# Altium schematic sheet P1.schdoc
size 889 x 421 mm; Symbol: Sheet-Symbol_A4; Company: 嘉立创EDA; Version: V1.0; Page Size: A4; @Project Name: New Project_2026-10-12_11-10-43; @Page Count: 1; @Update Date: 2026-10-15; @Create Date: 2026-10-12; @Schematic Name: Schematic1; @Page No: 1; @Page Name: P1; Device: Sheet-Symbol_A4
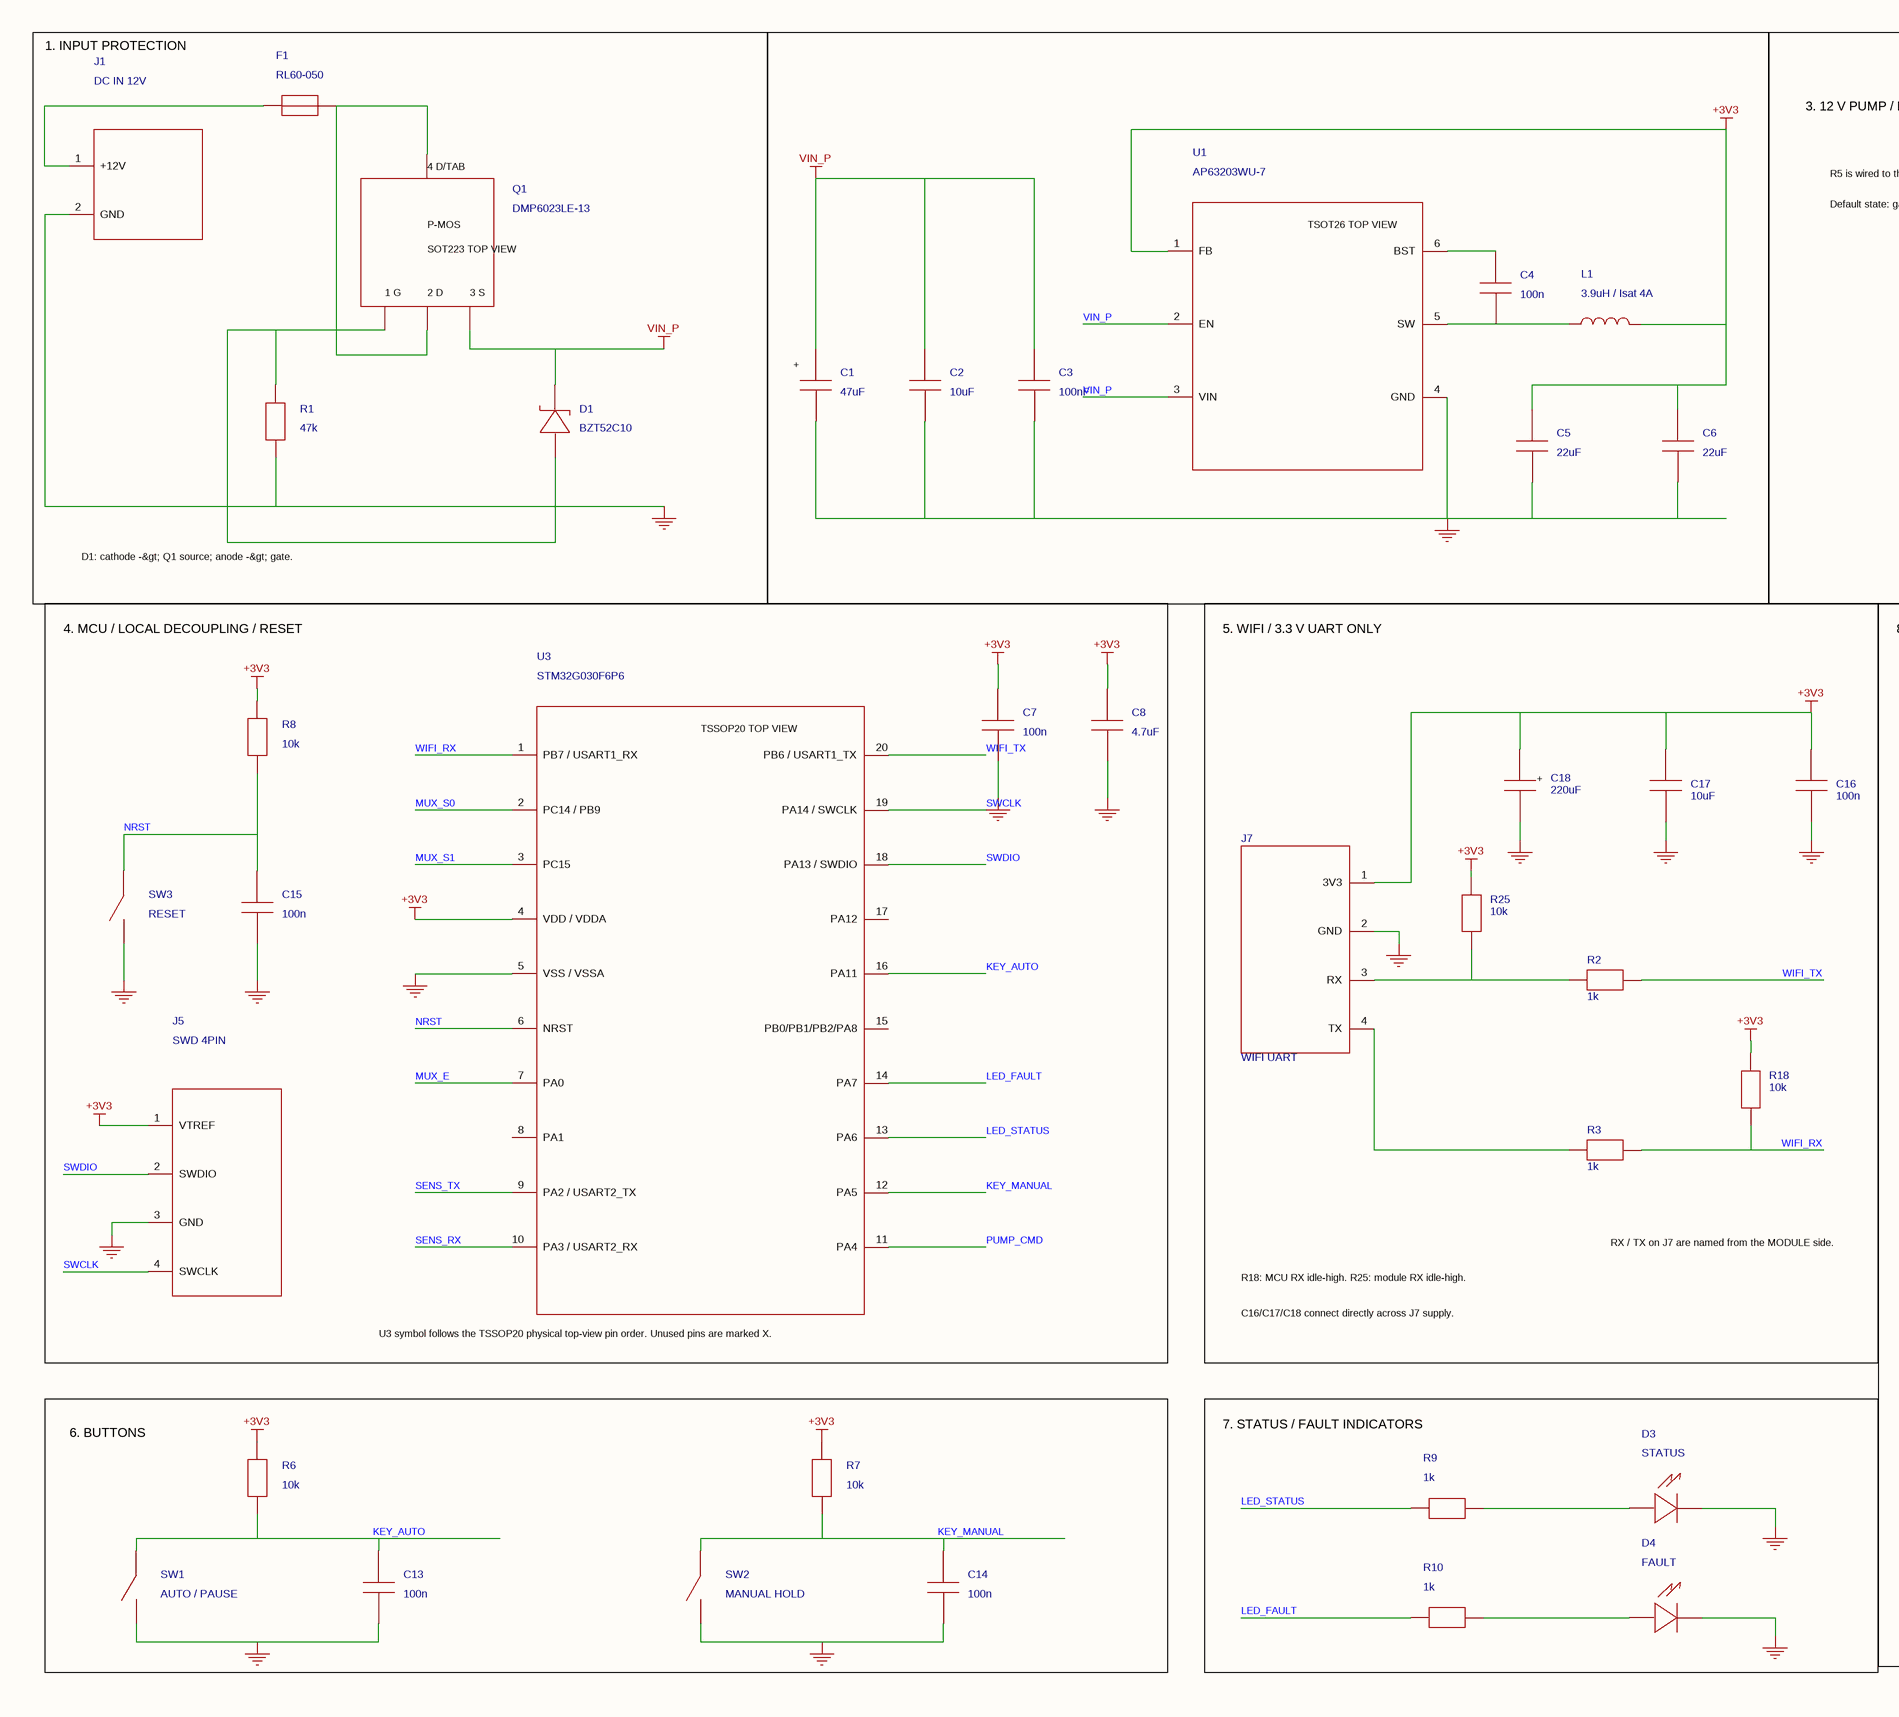
[diagram p0: P1.schdoc, left]
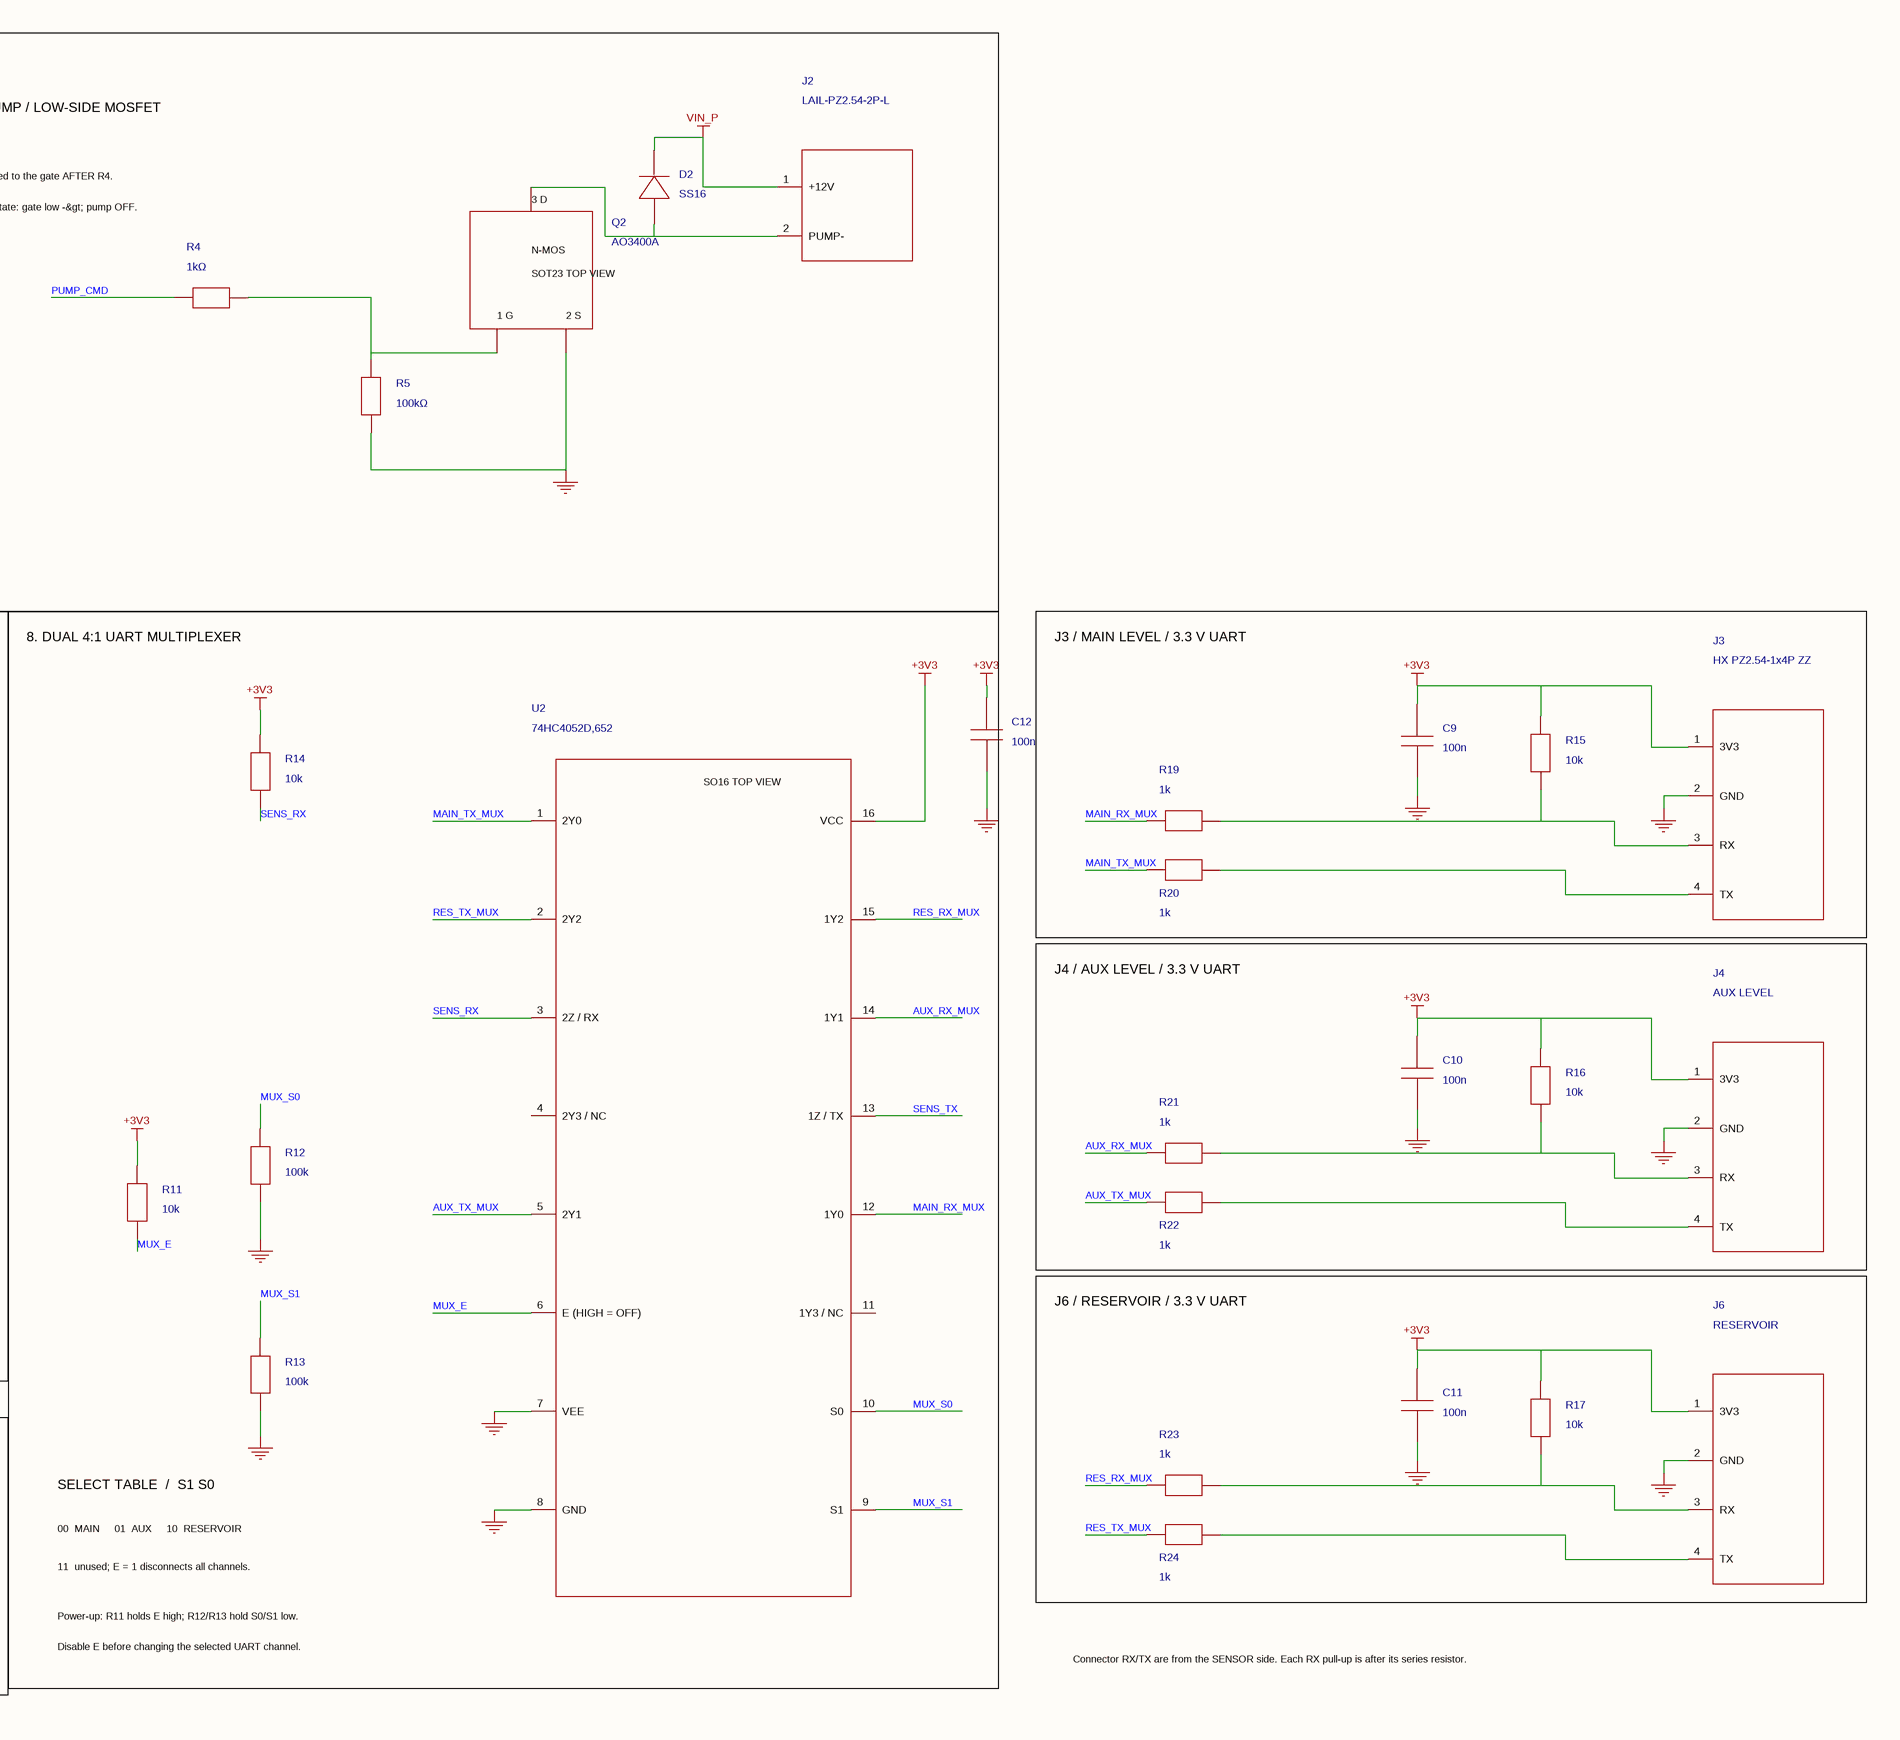
[diagram p1: P1.schdoc, right]

## Parts
C1  47uF  [CAP-TH_BD6.3-P2.50-D0.6-FD]
C2  10uF  [C0805]
C3  100nF  [C0805]
C4  100n
C5  22uF  [C0603]
C6  22uF  [C0603]
C7  100n
C8  4.7uF  [C0603]
C9  100n
C10  100n
C11  100n
C12  100n
C13  100n
C14  100n
C15  100n
C16  100n
C17  10uF  [C0603]
C18  220uF  [C1206]
D1  BZT52C10  [SOD-123_L2.7-W1.6-LS3.7-RD]
D2  SS16  [SMA_L4.3-W2.6-LS5.0-RD]
D3  STATUS
D4  FAULT
F1  RL60-050  [FUSE-TH_L7.8-W3.0-P5.10-D0.5-S2.00]
J1  DC IN 12V
J2  LAIL-PZ2.54-2P-L  [CONN-TH_LAIL-PZ2.54-2P-L]
J3  HX PZ2.54-1x4P ZZ  [HDR-TH_4P-P2.54-V-M]
J4  AUX LEVEL
J5  SWD 4PIN
J6  RESERVOIR
J7  WIFI UART
L1  3.9uH / Isat 4A
Q1  DMP6023LE-13
Q2  AO3400A
R1  47k
R2  1k
R3  1k
R4  1kΩ  [R0603]
R5  100kΩ  [R0603]
R6  10k
R7  10k
R8  10k
R9  1k
R10  1k
R11  10k
R12  100k
R13  100k
R14  10k
R15  10k
R16  10k
R17  10k
R18  10k
R19  1k
R20  1k
R21  1k
R22  1k
R23  1k
R24  1k
R25  10k
SW1  AUTO / PAUSE
SW2  MANUAL HOLD
SW3  RESET
U1  AP63203WU-7
U2  74HC4052D,652
U3  STM32G030F6P6

## Blocks framed on the sheet
1. INPUT PROTECTION: D1 F1 J1 Q1 R1
3. 12 V PUMP / LOW-SIDE MOSFET: D2 J2 Q2 R4 R5
4. MCU / LOCAL DECOUPLING / RESET: C7 C8 C15 J5 R8 SW3 U3
5. WIFI / 3.3 V UART ONLY: C16-C18 J7 R2 R3 R18 R25
J3 / MAIN LEVEL / 3.3 V UART: C9 J3 R15 R19 R20
J4 / AUX LEVEL / 3.3 V UART: C10 J4 R16 R21 R22
J6 / RESERVOIR / 3.3 V UART: C11 J6 R17 R23 R24
6. BUTTONS: C13 C14 R6 R7 SW1 SW2
7. STATUS / FAULT INDICATORS: D3 D4 R9 R10

## Nets
+3V3: C5.1 C6.1 C7.1 C8.1 C9.1 C10.1 C11.1 C12.1 C16.1 C17.1 C18.1 J3.1(3V3) J4.1(3V3) J5.1(VTREF) J6.1(3V3) J7.1(3V3) L1.2 R6.1 R7.1 R8.1 R11.1 R14.1 R15.1 R16.1 R17.1 R18.1 R25.1 U1.1(FB) U2.16(VCC) U3.4(VDD_/_VDDA)
GND: C1.2 C2.2 C3.2 C5.2 C6.2 C7.2 C8.2 C9.2 C10.2 C11.2 C12.2 C13.2 C14.2 C15.2 C16.2 C17.2 C18.2 D3.1(K) D4.1(K) J1.2(GND) J3.2(GND) J4.2(GND) J5.3(GND) J6.2(GND) J7.2(GND) Q2.2(S) R1.2 R5.2 R12.2 R13.2 SW1.2 SW2.2 SW3.2 U1.4(GND) U2.7(VEE) U2.8(GND) U3.5(VSS_/_VSSA)
VIN_P: C1.1 C2.1 C3.1 D1.1(K) D2.1(K) J2.1(+12V) Q1.3(S) U1.2(EN) U1.3(VIN)
AUX_RX_MUX: R21.1 U2.14(1Y1)
AUX_TX_MUX: R22.1 U2.5(2Y1)
KEY_AUTO: C13.1 R6.2 SW1.1 U3.16(PA11)
KEY_MANUAL: C14.1 R7.2 SW2.1 U3.12(PA5)
LED_FAULT: R10.1 U3.14(PA7)
LED_STATUS: R9.1 U3.13(PA6)
MAIN_RX_MUX: R19.1 U2.12(1Y0)
MAIN_TX_MUX: R20.1 U2.1(2Y0)
MUX_E: R11.2 U2.6(E_(HIGH_=_OFF)) U3.7(PA0)
MUX_S0: R12.1 U2.10(S0) U3.2(PC14_/_PB9)
MUX_S1: R13.1 U2.9(S1) U3.3(PC15)
NRST: C15.1 R8.2 SW3.1 U3.6(NRST)
PUMP_CMD: R4.1 U3.11(PA4)
RES_RX_MUX: R23.1 U2.15(1Y2)
RES_TX_MUX: R24.1 U2.2(2Y2)
SENS_RX: R14.2 U2.3(2Z_/_RX) U3.10(PA3_/_USART2_RX)
SENS_TX: U2.13(1Z_/_TX) U3.9(PA2_/_USART2_TX)
SWCLK: J5.4(SWCLK) U3.19(PA14_/_SWCLK)
SWDIO: J5.2(SWDIO) U3.18(PA13_/_SWDIO)
WIFI_RX: R3.1 R18.2 U3.1(PB7_/_USART1_RX)
WIFI_TX: R2.1 U3.20(PB6_/_USART1_TX)
NetC4_1: C4.1 U1.6(BST)
NetC4_2: C4.2 L1.1 U1.5(SW)
NetD1_2: D1.2(A) Q1.1(G) R1.1
NetD2_2: D2.2(A) J2.2(PUMP-) Q2.3(D)
NetD3_2: D3.2(A) R9.2
NetD4_2: D4.2(A) R10.2
NetF1_1: F1.1 J1.1(+12V)
NetF1_2: F1.2 Q1.2(D) Q1.4(D_/_TAB)
NetJ3_3: J3.3(RX) R15.2 R19.2
NetJ3_4: J3.4(TX) R20.2
NetJ4_3: J4.3(RX) R16.2 R21.2
NetJ4_4: J4.4(TX) R22.2
NetJ6_3: J6.3(RX) R17.2 R23.2
NetJ6_4: J6.4(TX) R24.2
NetJ7_3: J7.3(RX) R2.2 R25.2
NetJ7_4: J7.4(TX) R3.2
NetQ2_1: Q2.1(G) R4.2 R5.1

Not connected (* = marked no-connect by the designer): U2 4(2Y3_/_NC) 11(1Y3_/_NC); U3 8(PA1) 15(PB0/PB1/PB2/PA8) 17(PA12)

## Notes on the sheet
- R5 is wired to the gate AFTER R4.
- Default state: gate low -&gt; pump OFF.
- D1: cathode -&gt; Q1 source; anode -&gt; gate.
- 8. DUAL 4:1 UART MULTIPLEXER
- R18: MCU RX idle-high. R25: module RX idle-high.
- RX / TX on J7 are named from the MODULE side.
- U3 symbol follows the TSSOP20 physical top-view pin order. Unused pins are marked X.
- C16/C17/C18 connect directly across J7 supply.
- SELECT TABLE  /  S1 S0
- 00  MAIN     01  AUX     10  RESERVOIR
- 11  unused; E = 1 disconnects all channels.
- Power-up: R11 holds E high; R12/R13 hold S0/S1 low.
- Disable E before changing the selected UART channel.
- Connector RX/TX are from the SENSOR side. Each RX pull-up is after its series resistor.
- 更新日期
- 2026-10-15
- 原理图
- 图页
- Schematic1
- P1
- 创建日期
- 物料编码
- 2026-10-12
- 审阅
- 绘制
- New Project_2026-10-12_11-10-43
- 版本
- V1.0
- 尺寸
- A4
- 页
- 1
- 嘉立创EDA
- 共
- (in symbol 74HC4052D,652) SO16 TOP VIEW
- (in symbol AO3400A) 3 D; N-MOS; SOT23 TOP VIEW; 1 G; 2 S
- (in symbol AP63203WU-7) TSOT26 TOP VIEW
- (in symbol DMP6023LE-13) 4 D/TAB; P-MOS; SOT223 TOP VIEW; 1 G; 2 D; 3 S
- (in symbol ERA50V47M6X11) +
- (in symbol GRM31CR60J227ME11L) +
- (in symbol STM32G030F6P6) TSSOP20 TOP VIEW

## Library data of the parts
C1 = ERA50V47M6X11: 容值:47uF;精度:±20%;额定电压:50V;纹波电流:133mA@120Hz;; Manufacturer: JIERR(捷而瑞); Origin Footprint: CP_RADIAL_D8.0_P3.50; Symbol: CAPACITOR_POLARIZED_RADIAL; AddInBom: yes; ModelId: 3cdd55eab6a840dba93006d5a727d063; ModelTransform: 247.778,247.90446,0,0,0,0,0,0,-137.795; Tolerance: ±20%; Voltage Rating: 50V; Pin Spacing: 2.5mm; Lifetime: 2000hrs@105℃; Polarity type: 有极性; Device: ERA50V47M6X11; Design Item ID: CAPACITOR_POLARIZED_RADIAL; Library Name: Aquarium_ATO_PhysicalPin_V1_1; LCSC Part Name: 47uF ±20% 50V; SupplierPart: C49256811; ManufacturerPart: ERA50V47M6X11; Supplier Footprint: 插件,D6.3xL11mm; JLCPCB Part Class: Extended Part; Datasheet: https://item.szlcsc.com/datasheet/ERA50V47M6X11/51692211.html; Supplier: LCSC; ConvertToPcb: yes; FootprintName: CAP-TH_BD6.3-P2.50-D0.6-FD; ModelName: CAP-TH_BD6.3-P2.50-D0.6-FD; Value: 47uF; Ripple Current: 133mA@120Hz; Diameter: 6.3mm; Height - Seated (Max): 11mm; Operating Temperature: -40℃~+105℃
C2 = HGC0805R5106K500NSLJ: 容值:10uF;精度:±10%;额定电压:50V;温度系数:X5R;; Manufacturer: Chinocera(华瓷); Origin Footprint: C_1210_3225Metric; Symbol: CAPACITOR_C_1210_3225METRIC; AddInBom: yes; ModelId: 1ba041120af144c991958decab20d241; ModelName: C0805_L2.0-W1.3-H1.3; ModelTransform: 78.74,51.181,0,0,0,0,0,0.0005,0; Tolerance: ±10%; Voltage Rating: 50V; Temperature Coefficient: X5R; Device: HGC0805R5106K500NSLJ; Design Item ID: CAPACITOR_C_1210_3225METRIC; Library Name: Aquarium_ATO_PhysicalPin_V1_1; LCSC Part Name: 10uF ±10% 50V; SupplierPart: C22367830; ManufacturerPart: HGC0805R5106K500NSLJ; Supplier Footprint: 0805; JLCPCB Part Class: Extended Part; Datasheet: https://item.szlcsc.com/datasheet/HGC0805R5106K500NSLJ/23841135.html; Supplier: LCSC; ConvertToPcb: yes; FootprintName: C0805; Value: 10uF
C3 = CC0805KRX7R9BB104: 容值:100nF;精度:±10%;额定电压:50V;温度系数:X7R;; Manufacturer: YAGEO(国巨); Origin Footprint: C_0603_1608Metric; Symbol: CAPACITOR_C_0603_1608METRIC; AddInBom: yes; ModelId: 1ba041120af144c991958decab20d241; ModelName: C0805_L2.0-W1.3-H1.3; ModelTransform: 78.74,51.181,0,0,0,0,0,0.0005,0; Tolerance: ±10%; Voltage Rating: 50V; Temperature Coefficient: X7R; Device: CC0805KRX7R9BB104; Design Item ID: CAPACITOR_C_0603_1608METRIC; Library Name: Aquarium_ATO_PhysicalPin_V1_1; LCSC Part Name: 100nF ±10% 50V; SupplierPart: C49678; ManufacturerPart: CC0805KRX7R9BB104; Supplier Footprint: 0805; JLCPCB Part Class: Basic Part; Datasheet: https://item.szlcsc.com/datasheet/CC0805KRX7R9BB104/50686.html; Supplier: LCSC; ConvertToPcb: yes; FootprintName: C0805; Value: 100nF
C4 C7 C9-C16 = 100n: 100n; footprint C_0603_1608Metric; Symbol: CAPACITOR_C_0603_1608METRIC; AddInBom: yes; Origin Footprint: C_0603_1608Metric; Device: 100n; Design Item ID: CAPACITOR_C_0603_1608METRIC; Library Name: Aquarium_ATO_PhysicalPin_V1_1; ConvertToPcb: yes
C5 C6 = HGC0603R5226M100NTHJ: 容值:22uF;精度:±20%;额定电压:10V;温度系数:X5R;; Manufacturer: Chinocera(华瓷); Origin Footprint: C_0805_2012Metric; Symbol: CAPACITOR_C_0805_2012METRIC; AddInBom: yes; ModelId: ac125912035d415993ca9572d50418b1; ModelName: C0603_L1.6-W0.8-H0.8; ModelTransform: 62.992,31.496,0,0,0,0,0,0,0; Tolerance: ±20%; Voltage Rating: 10V; Temperature Coefficient: X5R; Device: HGC0603R5226M100NTHJ; Design Item ID: CAPACITOR_C_0805_2012METRIC; Library Name: Aquarium_ATO_PhysicalPin_V1_1; LCSC Part Name: 22uF ±20% 10V; SupplierPart: C7432770; ManufacturerPart: HGC0603R5226M100NTHJ; Supplier Footprint: 0603; JLCPCB Part Class: Extended Part; Datasheet: https://item.szlcsc.com/datasheet/HGC0603R5226M100NTHJ/8438252.html; Supplier: LCSC; ConvertToPcb: yes; FootprintName: C0603; Value: 22uF
C8 = CL10A475KP8NNNC: 容值:4.7uF;精度:±10%;额定电压:10V;温度系数:X5R;; Manufacturer: SAMSUNG(三星); Origin Footprint: C_0805_2012Metric; Symbol: CAPACITOR_C_0805_2012METRIC; AddInBom: yes; ModelId: ac125912035d415993ca9572d50418b1; ModelName: C0603_L1.6-W0.8-H0.8; ModelTransform: 62.992,31.496,0,0,0,0,0,0,0; Tolerance: ±10%; Voltage Rating: 10V; Temperature Coefficient: X5R; Device: CL10A475KP8NNNC; Design Item ID: CAPACITOR_C_0805_2012METRIC; Library Name: Aquarium_ATO_PhysicalPin_V1_1; LCSC Part Name: 4.7uF ±10% 10V; SupplierPart: C1705; ManufacturerPart: CL10A475KP8NNNC; Supplier Footprint: 0603; JLCPCB Part Class: Extended Part; Datasheet: https://item.szlcsc.com/datasheet/CL10A475KP8NNNC/2057.html; Supplier: LCSC; ConvertToPcb: yes; FootprintName: C0603; Value: 4.7uF
C17 = CGA0603X5R106K100JT: 容值:10uF;精度:±10%;额定电压:10V;温度系数:X5R;; Manufacturer: HRE(芯声); Origin Footprint: C_0805_2012Metric; Symbol: CAPACITOR_C_0805_2012METRIC; AddInBom: yes; ModelId: ac125912035d415993ca9572d50418b1; ModelName: C0603_L1.6-W0.8-H0.8; ModelTransform: 62.992,31.496,0,0,0,0,0,0,0; Tolerance: ±10%; Voltage Rating: 10V; Temperature Coefficient: X5R; Device: CGA0603X5R106K100JT; Design Item ID: CAPACITOR_C_0805_2012METRIC; Library Name: Aquarium_ATO_PhysicalPin_V1_1; LCSC Part Name: 10uF ±10% 10V; SupplierPart: C6119842; ManufacturerPart: CGA0603X5R106K100JT; Supplier Footprint: 0603; JLCPCB Part Class: Extended Part; Datasheet: https://item.szlcsc.com/datasheet/CGA0603X5R106K100JT/7062548.html; Supplier: LCSC; ConvertToPcb: yes; FootprintName: C0603; Value: 10uF
C18 = GRM31CR60J227ME11L: 容值:220uF;精度:±20%;额定电压:6.3V;温度系数:X5R;; Manufacturer: muRata(村田); Origin Footprint: CP_RADIAL_D8.0_P3.50; Symbol: CAPACITOR_POLARIZED_RADIAL; AddInBom: yes; ModelId: e4be705b945545a48e666415e3682bd8; ModelName: C1206_L3.2-W1.6-H1.3; ModelTransform: 125.984,62.992,0,0,0,0,0,0,0; Tolerance: ±20%; Voltage Rating: 6.3V; Temperature Coefficient: X5R; Device: GRM31CR60J227ME11L; Design Item ID: CAPACITOR_POLARIZED_RADIAL; Library Name: Aquarium_ATO_PhysicalPin_V1_1; LCSC Part Name: 220uF ±20% 6.3V; SupplierPart: C412252; ManufacturerPart: GRM31CR60J227ME11L; Supplier Footprint: 1206; JLCPCB Part Class: Extended Part; Datasheet: https://item.szlcsc.com/datasheet/GRM31CR60J227ME11L/404010.html; Supplier: LCSC; ConvertToPcb: yes; FootprintName: C1206; Value: 220uF
D1 = BZT52C10_C19077408: 二极管配置:1个独立式;稳压值(标称值):10V;稳压值(范围):9.5V~10.5V;耗散功率(Pd):350mW;; Manufacturer: R+O(宏嘉诚); Origin Footprint: SOD-123; Symbol: ZENER_DIODE; AddInBom: yes; ModelId: ad7e39f9e5534b3c96ffdc5532ebb493; ModelName: SOD-123_L2.7-W1.6-H1.4-LS3.7; ModelTransform: 146.026,62.992,0,180,0,0,0.0005,0,0; Diode Configuration: 1个独立式; Zener Voltage(Nom): 10V; Reverse Leakage Current (Ir): 200nA; Pd - Power Dissipation: 350mW; Impedance(Zzt): 20Ω; Impedance(Zzk): 150Ω; Operating Junction Temperature Range: -55℃~+150℃; Device: BZT52C10_C19077408; Design Item ID: ZENER_DIODE; Library Name: Aquarium_ATO_PhysicalPin_V1_1; LCSC Part Name: 表面贴装齐纳二极管; SupplierPart: C19077408; ManufacturerPart: BZT52C10; Supplier Footprint: SOD-123; JLCPCB Part Class: Extended Part; Datasheet: https://item.szlcsc.com/datasheet/BZT52C10/20275493.html; Supplier: LCSC; ConvertToPcb: yes; FootprintName: SOD-123_L2.7-W1.6-LS3.7-RD; Zener Voltage(Range): 9.5V~10.5V; Tolerance: -
D2 = SS16_C18199176: 二极管配置:独立式;正向压降(Vf):700mV@1A;直流反向耐压(Vr):60V;整流电流:1A;; Manufacturer: R+O(宏嘉诚); Origin Footprint: D_SMA; Symbol: DIODE; AddInBom: yes; ModelId: 8d2dd2e50a3a4b27821fa63d469a8f11; ModelTransform: 196.85,102.362,0,0,0,0,0,0,0; Diode Configuration: 独立式; Voltage - DC Reverse(Vr): 60V; Current - Rectified: 1A; Reverse Leakage Current (Ir): 200uA@60V; Operating Junction Temperature Range: -55℃~+150℃; Non-Repetitive Peak Forward Surge Current: 30A; Device: SS16_C18199176; Design Item ID: DIODE; Library Name: Aquarium_ATO_PhysicalPin_V1_1; LCSC Part Name: 电压:60V 电流:1A; SupplierPart: C18199176; ManufacturerPart: SS16; Supplier Footprint: SMA(DO-214AC); JLCPCB Part Class: Extended Part; Datasheet: https://item.szlcsc.com/datasheet/SS16/19354408.html; Supplier: LCSC; ConvertToPcb: yes; FootprintName: SMA_L4.3-W2.6-LS5.0-RD; ModelName: SMA_L4.3-W2.6-LS5.0-RD; Voltage - Forward(Vf@If): 700mV@1A; Power Dissipation: -
D3 = STATUS: STATUS; footprint LED_0603_1608Metric; AddInBom: yes; Origin Footprint: LED_0603_1608Metric; Device: STATUS; Symbol: LED_0603; Design Item ID: LED_0603; Library Name: Aquarium_ATO_PhysicalPin_V1_1; ConvertToPcb: yes
D4 = FAULT: FAULT; footprint LED_0603_1608Metric; AddInBom: yes; Origin Footprint: LED_0603_1608Metric; Device: FAULT; Symbol: LED_0603; Design Item ID: LED_0603; Library Name: Aquarium_ATO_PhysicalPin_V1_1; ConvertToPcb: yes
F1 = RL60-050: 耐压(Vmax):60V;最大电流(Imax):40A;保持电流(Ihold):500mA;跳闸电流(Itrip):1A;; Manufacturer: RUILON(瑞隆源); Origin Footprint: PPTC_RADIAL_P5.10_D8.0; Symbol: PTC_RESETTABLE_FUSE; AddInBom: yes; ModelId: a577626d9dfe4d5a9a614f24ba40a72e; ModelName: FUSE-TH_L7.8-W3.0-P5.1; ModelTransform: 306.809,102.362,0,0,0,0,0,0.005,-137.795; Voltage - Max: 60V; Current - Max: 40A; Hold Current: 500mA; Trip Current: 1A; Power Dissipation: 800mW; Resistance - Initial (Ri) (Min): 400mΩ; Resistance - Post Trip (R1) (Max): 1.2Ω; Time to Trip(Max): 4s; Device: RL60-050; Design Item ID: PTC_RESETTABLE_FUSE; Library Name: Aquarium_ATO_PhysicalPin_V1_1; LCSC Part Name: 60V 500mA 插件自恢复; SupplierPart: C21025; ManufacturerPart: RL60-050; Supplier Footprint: 插件,P=5.1mm; JLCPCB Part Class: Extended Part; Datasheet: https://item.szlcsc.com/datasheet/RL60-050/21737.html; Supplier: LCSC; ConvertToPcb: yes; FootprintName: FUSE-TH_L7.8-W3.0-P5.10-D0.5-S2.00; Operating Temperature: -40℃~+85℃; Length: 7.9mm; Width: -; Height: -; Pitch: -
J1 = DC IN 12V: DC IN 12V; footprint TB_2P_P5.08; Symbol: DC_INPUT_2P; AddInBom: yes; Origin Footprint: TB_2P_P5.08; Device: DC IN 12V; Design Item ID: DC_INPUT_2P; Library Name: Aquarium_ATO_PhysicalPin_V1_1; ConvertToPcb: yes
J2 = LAIL-PZ2.54-2P-L: 插针结构:1x2P;间距:2.54mm;圆针/方针:方针;安装方式:直插;排数:单排;总PIN位数:2P;额定电流:3A;额定电压:250V;配合针长度:6mm;塑高:2.5mm;端接针长度:3mm;触头材质:黄铜;触头镀层:金;工作温度:-25℃~+80℃;颜色:黑色;; Manufacturer: LAILAN(莱联); Origin Footprint: TB_2P_P5.08; Symbol: PUMP_OUTPUT_2P; AddInBom: yes; ModelId: 70c31e2428a5487fb484c07092e505d3; ModelName: HDR-TH_LAIL-PZ2.54-2P-L; ModelTransform: 200.03897,98.425,0,0,0,0,0,0,-118.11; Pin Structure: 1x2P; Pitch: 2.54mm; Circluar Pins/Square Pins: 方针; Current Rating: 3A; Voltage Rating (Max): 250V; Device: LAIL-PZ2.54-2P-L; Design Item ID: PUMP_OUTPUT_2P; Library Name: Aquarium_ATO_PhysicalPin_V1_1; LCSC Part Name: 1x2P 间距:2.54mm 方针 直插; SupplierPart: C54950603; ManufacturerPart: LAIL-PZ2.54-2P-L; Supplier Footprint: 插件,P=2.54mm; JLCPCB Part Class: Extended Part; Datasheet: https://item.szlcsc.com/datasheet/LAIL-PZ2.54-2P-L/58519956.html; Supplier: LCSC; ConvertToPcb: yes; FootprintName: CONN-TH_LAIL-PZ2.54-2P-L; Mounting Type: 直插; Number of Rows: 单排; Number of Pins: 2P; Length of Mating Pin: 6mm; Insulation Height: 2.5mm; Length of End Connection Pin: 3mm; Contact Material: 黄铜; Contact Plating: 金; Operating Temperature: -25℃~+80℃; Color: 黑色
J3 = HX PZ2.54-1x4P ZZ: 插针结构:1x4P;间距:2.54mm;行距:-;圆针/方针:方针;安装方式:直插;排数:单排;总PIN位数:4P;额定电流:3A;额定电压:1kV;配合针长度:6mm;塑高:2.5mm;端接针长度:3mm;触头材质:黄铜;触头镀层:金;工作温度:-40℃~+105℃;颜色:黑色;; Manufacturer: hanxia(韩下); Origin Footprint: HDR_1x4_P2.54; Symbol: SENSOR_UART_4P; AddInBom: yes; ModelId: 112f4d05e8d64e99ab9a333894bea4f9; ModelName: HDR-TH_4P-P2.54-M-LI-1X4P; ModelTransform: 399.999,104.7242,0,0,0,0,0,0,-118.11; Pin Structure: 1x4P; Pitch: 2.54mm; Circluar Pins/Square Pins: 方针; Current Rating: 3A; Voltage Rating (Max): 1kV; Device: HX PZ2.54-1x4P ZZ; Design Item ID: SENSOR_UART_4P; Library Name: Aquarium_ATO_PhysicalPin_V1_1; LCSC Part Name: 1x4P 间距:2.54mm 方针 直插; SupplierPart: C32713270; ManufacturerPart: HX PZ2.54-1x4P ZZ; Supplier Footprint: 插件,P=2.54mm; JLCPCB Part Class: Extended Part; Datasheet: https://item.szlcsc.com/datasheet/HX%2520PZ2.54-1x4P%2520ZZ/34444550.html; Supplier: LCSC; ConvertToPcb: yes; FootprintName: HDR-TH_4P-P2.54-V-M; Row Spacing: -; Mounting Type: 直插; Number of Rows: 单排; Number of Pins: 4P; Length of Mating Pin: 6mm; Insulation Height: 2.5mm; Length of End Connection Pin: 3mm; Contact Material: 黄铜; Contact Plating: 金; Operating Temperature: -40℃~+105℃; Color: 黑色; Supplementary Features: -
J4 = AUX LEVEL: AUX LEVEL; footprint HDR_1x4_P2.54; Symbol: SENSOR_UART_4P; AddInBom: yes; Origin Footprint: HDR_1x4_P2.54; Device: AUX LEVEL; Design Item ID: SENSOR_UART_4P; Library Name: Aquarium_ATO_PhysicalPin_V1_1; ConvertToPcb: yes
J5 = SWD 4PIN: SWD 4PIN; footprint HDR_1x4_P2.54; Symbol: SWD_4P; AddInBom: yes; Origin Footprint: HDR_1x4_P2.54; Device: SWD 4PIN; Design Item ID: SWD_4P; Library Name: Aquarium_ATO_PhysicalPin_V1_1; ConvertToPcb: yes
J6 = RESERVOIR: RESERVOIR; footprint HDR_1x4_P2.54; Symbol: SENSOR_UART_4P; AddInBom: yes; Origin Footprint: HDR_1x4_P2.54; Device: RESERVOIR; Design Item ID: SENSOR_UART_4P; Library Name: Aquarium_ATO_PhysicalPin_V1_1; ConvertToPcb: yes
J7 = WIFI UART: WIFI UART; footprint HDR_1x4_P2.54; Symbol: WIFI_UART_4P; AddInBom: yes; Origin Footprint: HDR_1x4_P2.54; Device: WIFI UART; Design Item ID: WIFI_UART_4P; Library Name: Aquarium_ATO_PhysicalPin_V1_1; ConvertToPcb: yes
L1 = 3.9uH / Isat 4A: 3.9uH / Isat 4A; footprint IND_SMD_6.0x6.0; Symbol: INDUCTOR_6X6; AddInBom: yes; Origin Footprint: IND_SMD_6.0x6.0; Device: 3.9uH / Isat 4A; Design Item ID: INDUCTOR_6X6; Library Name: Aquarium_ATO_PhysicalPin_V1_1; ConvertToPcb: yes
Q1 = DMP6023LE-13: DMP6023LE-13; package SOT223 (tab/pad 4 = drain); footprint SOT-223-4; Symbol: PMOS_DMP6023LE; AddInBom: yes; Origin Footprint: SOT-223-4; Device: DMP6023LE-13; Design Item ID: PMOS_DMP6023LE; Library Name: Aquarium_ATO_PhysicalPin_V1_1; ConvertToPcb: yes
Q2 = AO3400A: AO3400A; package SOT23; footprint SOT-23-3; Symbol: NMOS_AO3400A; AddInBom: yes; Origin Footprint: SOT-23-3; Device: AO3400A; Design Item ID: NMOS_AO3400A; Library Name: Aquarium_ATO_PhysicalPin_V1_1; ConvertToPcb: yes
R1 = 47k: 47k; footprint R_0603_1608Metric; Symbol: RESISTOR_0603; AddInBom: yes; Origin Footprint: R_0603_1608Metric; Device: 47k; Design Item ID: RESISTOR_0603; Library Name: Aquarium_ATO_PhysicalPin_V1_1; ConvertToPcb: yes
R2 R3 R9 R10 R19-R24 = 1k: 1k; footprint R_0603_1608Metric; Symbol: RESISTOR_0603; AddInBom: yes; Origin Footprint: R_0603_1608Metric; Device: 1k; Design Item ID: RESISTOR_0603; Library Name: Aquarium_ATO_PhysicalPin_V1_1; ConvertToPcb: yes
R4 = 0603WAF1001T5E: 电阻类型:厚膜电阻;阻值:1kΩ;精度:±1%;功率:100mW;工作电压:75V;温度系数:±100ppm/℃;; Manufacturer: UNI-ROYAL(厚声); Origin Footprint: R_0603_1608Metric; Symbol: RESISTOR_0603; AddInBom: yes; ModelId: fc143cca1e79419f9cd78b61e9279f08; ModelTransform: 31.8897,63.7794,0,90,0,0,0,0,0; Tolerance: ±1%; Power(Watts): 100mW; Voltage-Supply(Max): 75V; Device: 0603WAF1001T5E; Design Item ID: RESISTOR_0603; Library Name: Aquarium_ATO_PhysicalPin_V1_1; LCSC Part Name: 1kΩ ±1% 100mW 厚膜电阻; SupplierPart: C21190; ManufacturerPart: 0603WAF1001T5E; Supplier Footprint: 0603; JLCPCB Part Class: Basic Part; Datasheet: https://item.szlcsc.com/datasheet/0603WAF1001T5E/21904.html; Supplier: LCSC; ConvertToPcb: yes; FootprintName: R0603; ModelName: R0603; Type: 厚膜电阻; Value: 1kΩ; Temperature Coefficient: ±100ppm/℃; Operating Temperature: -55℃~+155℃
R5 = 0603WAF1003T5E: 电阻类型:厚膜电阻;阻值:100kΩ;精度:±1%;功率:100mW;工作电压:75V;温度系数:±100ppm/℃;; Manufacturer: UNI-ROYAL(厚声); Origin Footprint: R_0603_1608Metric; Symbol: RESISTOR_0603; AddInBom: yes; ModelId: fc143cca1e79419f9cd78b61e9279f08; ModelTransform: 31.8897,63.7794,0,90,0,0,0,0,0; Tolerance: ±1%; Power(Watts): 100mW; Voltage-Supply(Max): 75V; Device: 0603WAF1003T5E; Design Item ID: RESISTOR_0603; Library Name: Aquarium_ATO_PhysicalPin_V1_1; LCSC Part Name: 厚膜电阻 100kΩ ±1%; SupplierPart: C25803; ManufacturerPart: 0603WAF1003T5E; Supplier Footprint: 0603; JLCPCB Part Class: Basic Part; Datasheet: https://item.szlcsc.com/datasheet/0603WAF1003T5E/26546.html; Supplier: LCSC; ConvertToPcb: yes; FootprintName: R0603; ModelName: R0603; Type: 厚膜电阻; Value: 100kΩ; Temperature Coefficient: ±100ppm/℃; Operating Temperature: -55℃~+155℃
R6-R8 R11 R14-R18 R25 = 10k: 10k; footprint R_0603_1608Metric; Symbol: RESISTOR_0603; AddInBom: yes; Origin Footprint: R_0603_1608Metric; Device: 10k; Design Item ID: RESISTOR_0603; Library Name: Aquarium_ATO_PhysicalPin_V1_1; ConvertToPcb: yes
R12 R13 = 100k: 100k; footprint R_0603_1608Metric; Symbol: RESISTOR_0603; AddInBom: yes; Origin Footprint: R_0603_1608Metric; Device: 100k; Design Item ID: RESISTOR_0603; Library Name: Aquarium_ATO_PhysicalPin_V1_1; ConvertToPcb: yes
SW1 = AUTO / PAUSE: AUTO / PAUSE; footprint SW_TACT_6x6_4P; Symbol: SWITCH_TACT_6X6; AddInBom: yes; Origin Footprint: SW_TACT_6x6_4P; Device: AUTO / PAUSE; Design Item ID: SWITCH_TACT_6X6; Library Name: Aquarium_ATO_PhysicalPin_V1_1; ConvertToPcb: yes
SW2 = MANUAL HOLD: MANUAL HOLD; footprint SW_TACT_6x6_4P; Symbol: SWITCH_TACT_6X6; AddInBom: yes; Origin Footprint: SW_TACT_6x6_4P; Device: MANUAL HOLD; Design Item ID: SWITCH_TACT_6X6; Library Name: Aquarium_ATO_PhysicalPin_V1_1; ConvertToPcb: yes
SW3 = RESET: RESET; footprint SW_TACT_6x6_4P; Symbol: SWITCH_TACT_6X6; AddInBom: yes; Origin Footprint: SW_TACT_6x6_4P; Device: RESET; Design Item ID: SWITCH_TACT_6X6; Library Name: Aquarium_ATO_PhysicalPin_V1_1; ConvertToPcb: yes
U1 = AP63203WU-7: AP63203WU-7; package TSOT26; footprint TSOT-23-6_P0.95; Symbol: AP63203WU_7; AddInBom: yes; Origin Footprint: TSOT-23-6_P0.95; Device: AP63203WU-7; Design Item ID: AP63203WU_7; Library Name: Aquarium_ATO_PhysicalPin_V1_1; ConvertToPcb: yes
U2 = 74HC4052D,652: 74HC4052D,652; package SO16 (SOT109-1); footprint SOIC-16_P1.27; AddInBom: yes; Origin Footprint: SOIC-16_P1.27; Device: 74HC4052D,652; Symbol: 74HC4052D; Design Item ID: 74HC4052D; Library Name: Aquarium_ATO_PhysicalPin_V1_1; ConvertToPcb: yes
U3 = STM32G030F6P6: STM32G030F6P6; package TSSOP20; footprint TSSOP-20_P0.65; AddInBom: yes; Origin Footprint: TSSOP-20_P0.65; Device: STM32G030F6P6; Symbol: STM32G030F6P6; Design Item ID: STM32G030F6P6; Library Name: Aquarium_ATO_PhysicalPin_V1_1; ConvertToPcb: yes